# EAGLE schematic EPGcontrol-TOLDO (EAGLE 7.7.0)
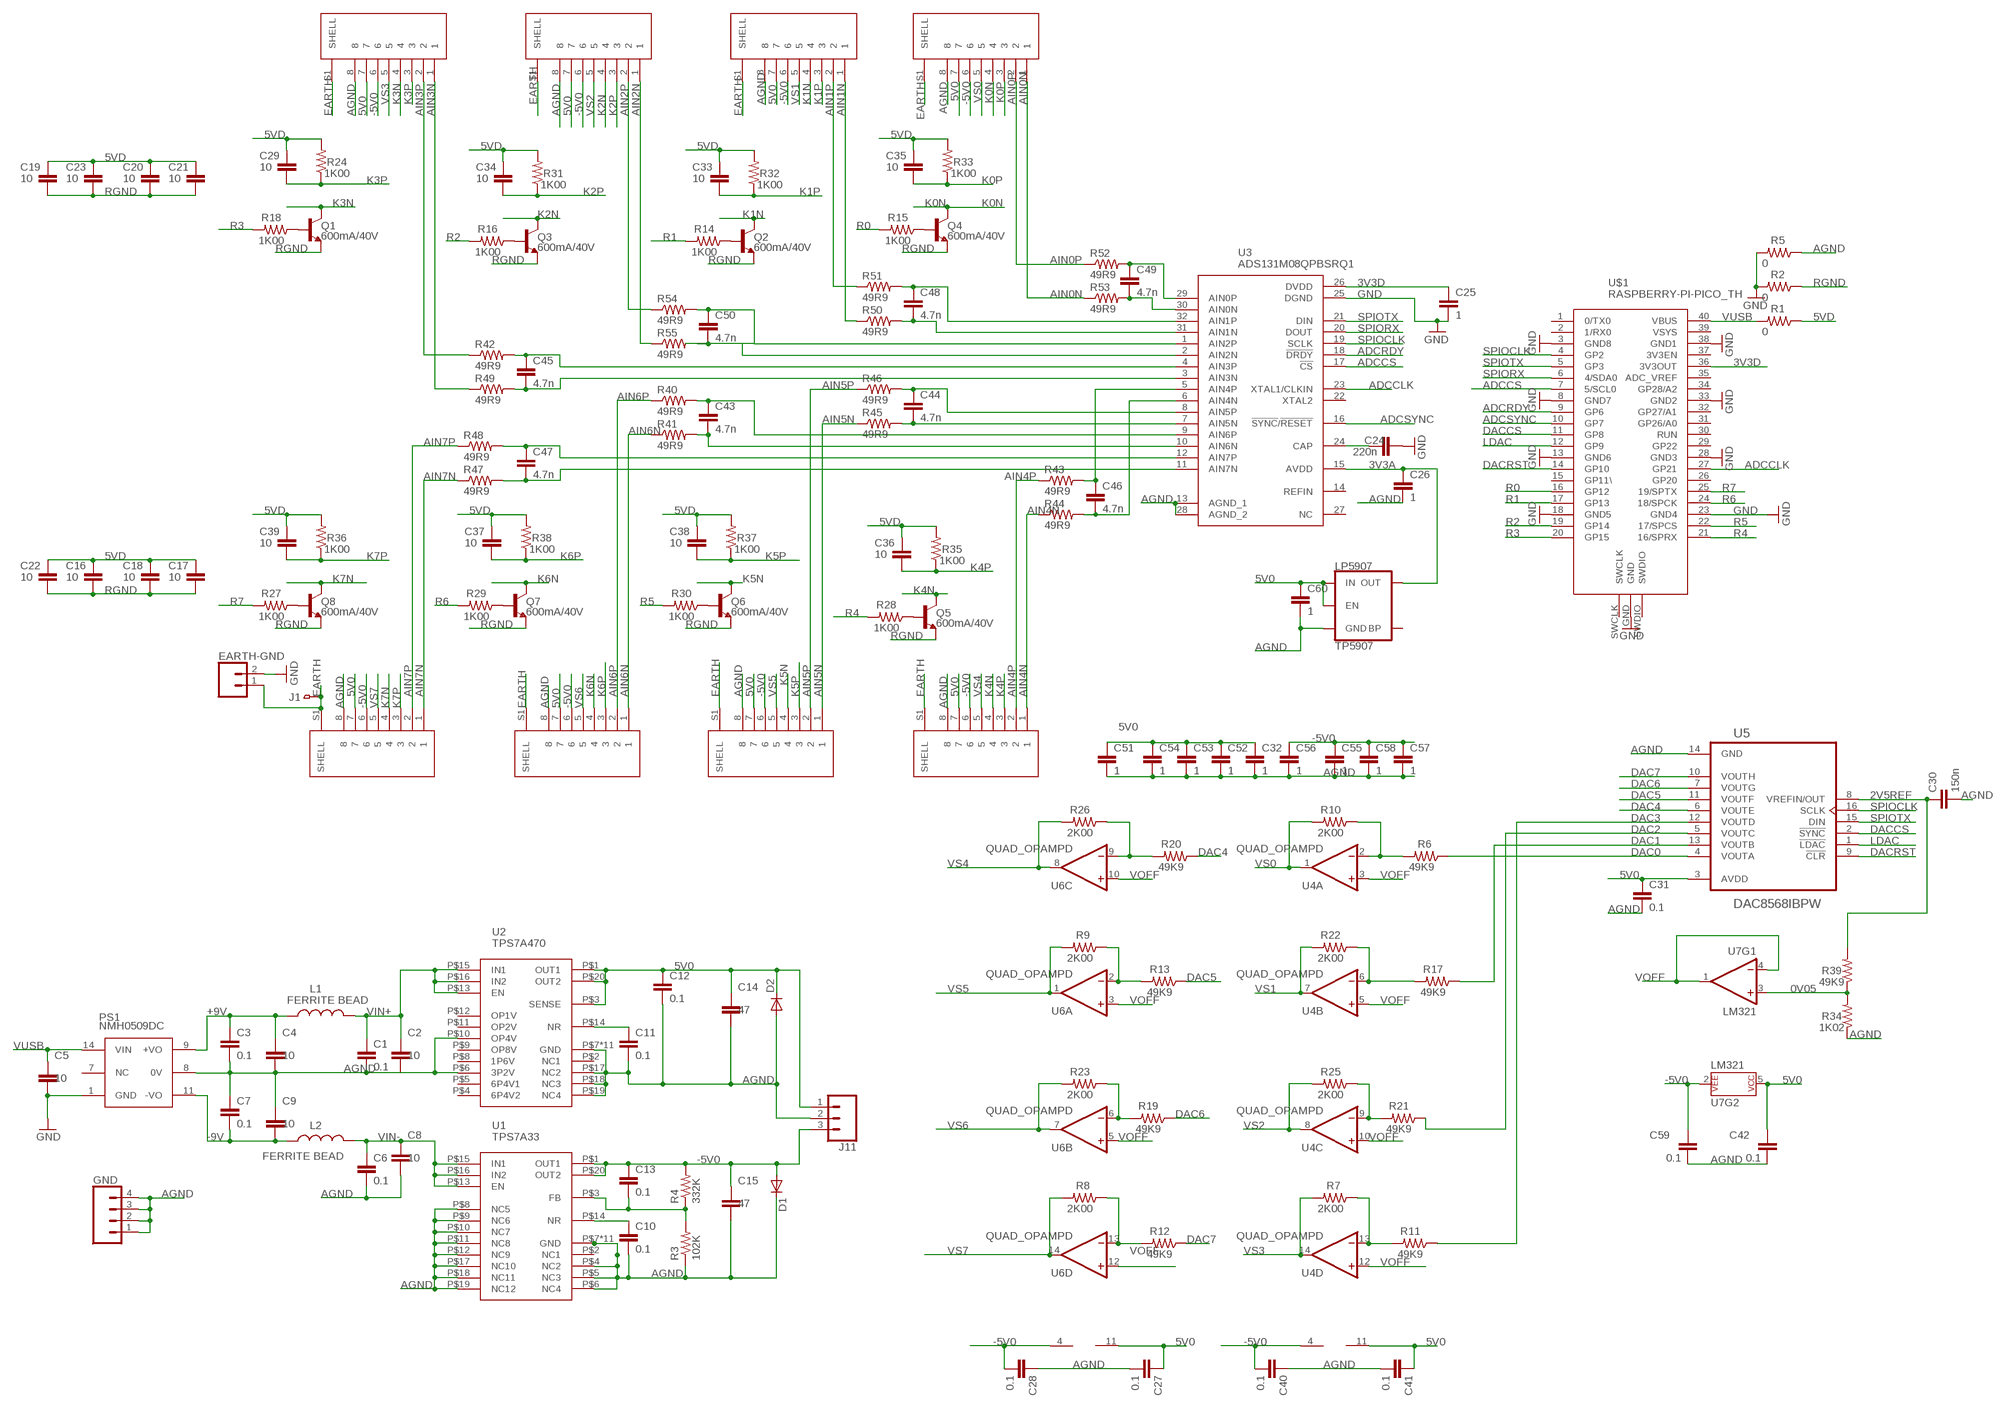
[diagram p0: schematic, sheet 1]

## Parts
C1  0.1  CAPS0603S  [0603S]
C2  10  CAPS1210S  [1210S]
C3  0.1  CAPS0603S  [0603S]
C4  10  CAPS1210S  [1210S]
C5  10  CAPS1210S  [1210S]
C6  0.1  CAPS0603S  [0603S]
C7  0.1  CAPS0603S  [0603S]
C8  10  CAPS1210S  [1210S]
C9  10  CAPS1210S  [1210S]
C10  0.1  CAPS0603S  [0603S]
C11  0.1  CAPS0603S  [0603S]
C12  0.1  CAPS0603S  [0603S]
C13  0.1  CAPS0603S  [0603S]
C14  47  CAPS1210S  [1210S]
C15  47  CAPS1210S  [1210S]
C16  10  CAPS1206S  [1206S]
C17  10  CAPS1206S  [1206S]
C18  10  CAPS1206S  [1206S]
C19  10  CAPS1206S  [1206S]
C20  10  CAPS1206S  [1206S]
C21  10  CAPS1206S  [1206S]
C22  10  CAPS1206S  [1206S]
C23  10  CAPS1206S  [1206S]
C24  220n  CAPS0603S  [0603S]
C25  1  CAPS0805S  [0805S]
C26  1  CAPS0805S  [0805S]
C27  0.1  CAPS0603S  [0603S]
C28  0.1  CAPS0603S  [0603S]
C29  10  CAPS1206S  [1206S]
C30  150n  CAPS0603S  [0603S]
C31  0.1  CAPS0603S  [0603S]
C32  1  CAPS0805S  [0805S]
C33  10  CAPS1206S  [1206S]
C34  10  CAPS1206S  [1206S]
C35  10  CAPS1206S  [1206S]
C36  10  CAPS1206S  [1206S]
C37  10  CAPS1206S  [1206S]
C38  10  CAPS1206S  [1206S]
C39  10  CAPS1206S  [1206S]
C40  0.1  CAPS0603S  [0603S]
C41  0.1  CAPS0603S  [0603S]
C42  0.1  CAPS0603S  [0603S]
C43  4.7n  CAPS0805S  [0805S]
C44  4.7n  CAPS0805S  [0805S]
C45  4.7n  CAPS0805S  [0805S]
C46  4.7n  CAPS0805S  [0805S]
C47  4.7n  CAPS0805S  [0805S]
C48  4.7n  CAPS0805S  [0805S]
C49  4.7n  CAPS0805S  [0805S]
C50  4.7n  CAPS0805S  [0805S]
C51  1  CAPS0805S  [0805S]
C52  1  CAPS0805S  [0805S]
C53  1  CAPS0805S  [0805S]
C54  1  CAPS0805S  [0805S]
C55  1  CAPS0805S  [0805S]
C56  1  CAPS0805S  [0805S]
C57  1  CAPS0805S  [0805S]
C58  1  CAPS0805S  [0805S]
C59  0.1  CAPS0603S  [0603S]
C60  1  CAPS0805S  [0805S]
D1  DIODESMA  [SMA-DIODE]
D2  DIODESMA  [SMA-DIODE]
EARTH-GND  CONN_02LOCK  [1X02_LOCK]
GND  CONN_04LOCK  [1X04_LOCK]
J1  PADPAD_040  [PAD_040]
J2  54-00248  [TENSILITY_54-00248]
J3  54-00248  [TENSILITY_54-00248]
J4  54-00248  [TENSILITY_54-00248]
J5  54-00248  [TENSILITY_54-00248]
J6  54-00248  [TENSILITY_54-00248]
J7  54-00248  [TENSILITY_54-00248]
J8  54-00248  [TENSILITY_54-00248]
J9  54-00248  [TENSILITY_54-00248]
J11  CONN_03LOCK  [1X03_LOCK]
L1  FERRITE BEAD  INDUCTOR_SM0805S  [0805S]
L2  FERRITE BEAD  INDUCTOR_SM0805S  [0805S]
LP5907  TP5907  V_REG_MIC52193.3V  [SOT23-5]
PS1  NMH0509DC  DC-DC-PDS1-DUALPDM2  [PDM2]
Q1  600mA/40V  TRANS_NPN-MMBT2222AL  [SOT23-3]
Q2  600mA/40V  TRANS_NPN-MMBT2222AL  [SOT23-3]
Q3  600mA/40V  TRANS_NPN-MMBT2222AL  [SOT23-3]
Q4  600mA/40V  TRANS_NPN-MMBT2222AL  [SOT23-3]
Q5  600mA/40V  TRANS_NPN-MMBT2222AL  [SOT23-3]
Q6  600mA/40V  TRANS_NPN-MMBT2222AL  [SOT23-3]
Q7  600mA/40V  TRANS_NPN-MMBT2222AL  [SOT23-3]
Q8  600mA/40V  TRANS_NPN-MMBT2222AL  [SOT23-3]
R1  0  RESISTOR_SM0805S  [0805S]
R2  0  RESISTOR_SM0805S  [0805S]
R3  102K  R-US_R0805  [R0805]
R4  332K  R-US_R0805  [R0805]
R5  0  RESISTOR_SM0805S  [0805S]
R6  49K9  RESISTOR_SM0805S  [0805S]
R7  2K00  RESISTOR_SM0805S  [0805S]
R8  2K00  RESISTOR_SM0805S  [0805S]
R9  2K00  RESISTOR_SM0805S  [0805S]
R10  2K00  RESISTOR_SM0805S  [0805S]
R11  49K9  RESISTOR_SM0805S  [0805S]
R12  49K9  RESISTOR_SM0805S  [0805S]
R13  49K9  RESISTOR_SM0805S  [0805S]
R14  1K00  RESISTOR_SM0805S  [0805S]
R15  1K00  RESISTOR_SM0805S  [0805S]
R16  1K00  RESISTOR_SM0805S  [0805S]
R17  49K9  RESISTOR_SM0805S  [0805S]
R18  1K00  RESISTOR_SM0805S  [0805S]
R19  49K9  RESISTOR_SM0805S  [0805S]
R20  49K9  RESISTOR_SM0805S  [0805S]
R21  49K9  RESISTOR_SM0805S  [0805S]
R22  2K00  RESISTOR_SM0805S  [0805S]
R23  2K00  RESISTOR_SM0805S  [0805S]
R24  1K00  RESISTOR_SM0805S  [0805S]
R25  2K00  RESISTOR_SM0805S  [0805S]
R26  2K00  RESISTOR_SM0805S  [0805S]
R27  1K00  RESISTOR_SM0805S  [0805S]
R28  1K00  RESISTOR_SM0805S  [0805S]
R29  1K00  RESISTOR_SM0805S  [0805S]
R30  1K00  RESISTOR_SM0805S  [0805S]
R31  1K00  RESISTOR_SM0805S  [0805S]
R32  1K00  RESISTOR_SM0805S  [0805S]
R33  1K00  RESISTOR_SM0805S  [0805S]
R34  1K02  RESISTOR_SM0805S  [0805S]
R35  1K00  RESISTOR_SM0805S  [0805S]
R36  1K00  RESISTOR_SM0805S  [0805S]
R37  1K00  RESISTOR_SM0805S  [0805S]
R38  1K00  RESISTOR_SM0805S  [0805S]
R39  49K9  RESISTOR_SM0805S  [0805S]
R40  49R9  RESISTOR_SM0805S  [0805S]
R41  49R9  RESISTOR_SM0805S  [0805S]
R42  49R9  RESISTOR_SM0805S  [0805S]
R43  49R9  RESISTOR_SM0805S  [0805S]
R44  49R9  RESISTOR_SM0805S  [0805S]
R45  49R9  RESISTOR_SM0805S  [0805S]
R46  49R9  RESISTOR_SM0805S  [0805S]
R47  49R9  RESISTOR_SM0805S  [0805S]
R48  49R9  RESISTOR_SM0805S  [0805S]
R49  49R9  RESISTOR_SM0805S  [0805S]
R50  49R9  RESISTOR_SM0805S  [0805S]
R51  49R9  RESISTOR_SM0805S  [0805S]
R52  49R9  RESISTOR_SM0805S  [0805S]
R53  49R9  RESISTOR_SM0805S  [0805S]
R54  49R9  RESISTOR_SM0805S  [0805S]
R55  49R9  RESISTOR_SM0805S  [0805S]
U1  TPS7A33  [VQFN-20-5X5]
U2  TPS7A470  TPS7A470X  [VQFN-20-5X5]
U3  ADS131M08QPBSRQ1  [QFP50P700X700X120-32N]
U4  QUAD_OPAMPD  [SO14]
U5  DAC8568IBPW  [SOP65P640X120-16N]
U6  QUAD_OPAMPD  [SO14]
U7  LM321  OPA344  [SOT23-5]
U$1  RASPBERRY-PI-PICO_TH  [FT_RASPBERRY-PI-PICO_TH]

## Nets
0V05: R34.2 R39.1 U7.3(+IN)
2V5REF: C30.1 R39.2 U5.8(VREFIN/OUT)
3V3A: C26.1 LP5907.5(OUT) U3.15(AVDD)
3V3D: C25.1 U3.26(DVDD) U$1.36(3V3OUT)
5V0: C12.1 C14.1 C27.1 C31.1 C32.1 C41.1 C42.1 C51.1 C52.1 C53.1 C54.1 C60.1 D2.C J2.7 J3.7 J4.7 J5.7 J6.7 J7.7 J8.7 J9.7 J11.1 LP5907.1(IN) LP5907.3(EN) U2.P$1(OUT1) U2.P$3(SENSE) U2.P$20(OUT2) U4.11(P:V-) U5.3(AVDD) U6.11(P:V-) U7.5(P$V+)
5VD: C16.1 C17.1 C18.1 C19.1 C20.1 C21.1 C22.1 C23.1 C29.1 C33.1 C34.1 C35.1 C36.1 C37.1 C38.1 C39.1 R1.1 R24.2 R31.2 R32.2 R33.2 R35.2 R36.2 R37.2 R38.2
+9V: C3.1 C4.1 L1.1 PS1.9(+VO)
-5V0: C13.1 C15.1 C28.2 C40.2 C55.1 C56.1 C57.1 C58.1 C59.1 D1.A J2.6 J3.6 J4.6 J5.6 J6.6 J7.6 J8.6 J9.6 J11.3 R4.2 U1.P$1(OUT1) U1.P$20(OUT2) U4.4(P:V+) U6.4(P:V+) U7.2(P$V-)
-9V: C7.2 C9.2 L2.1 PS1.11(-VO)
A0N: C49.2 R53.2 U3.30(AIN0N)
A0P: C49.1 R52.2 U3.29(AIN0P)
A1N: C48.2 R50.2 U3.31(AIN1N)
A1P: C48.1 R51.2 U3.32(AIN1P)
A2N: C50.2 R55.2 U3.2(AIN2N)
A2P: C50.1 R54.2 U3.1(AIN2P)
A3N: C45.2 R49.2 U3.3(AIN3N)
A3P: C45.1 R42.2 U3.4(AIN3P)
A4N: C46.2 R44.2 U3.6(AIN4N)
A4P: C46.1 R43.2 U3.5(AIN4P)
A5N: C44.2 R45.2 U3.7(AIN5N)
A5P: C44.1 R46.2 U3.8(AIN5P)
A6N: C43.2 R41.2 U3.10(AIN6N)
A6P: C43.1 R40.2 U3.9(AIN6P)
A7N: C47.2 R47.2 U3.11(AIN7N)
A7P: C47.1 R48.2 U3.12(AIN7P)
ADCCLK: U3.23(XTAL1/CLKIN) U$1.27(GP21)
ADCCS: U3.17(!CS) U$1.7(5/SCL0)
ADCRDY: U3.18(!DRDY) U$1.9(GP6)
ADCSYNC: U3.16(!SYNC!/!RESET) U$1.10(GP7)
AGND: C1.2 C2.2 C3.2 C4.2 C6.2 C7.1 C8.2 C9.1 C10.2 C11.2 C12.2 C14.2 C15.2 C26.2 C27.2 C28.1 C30.2 C31.2 C32.2 C40.1 C41.2 C42.2 C51.2 C52.2 C53.2 C54.2 C55.2 C56.2 C57.2 C58.2 C59.2 C60.2 D1.C D2.A GND.1 GND.2 GND.3 GND.4 J2.8 J3.8 J4.8 J5.8 J6.8 J7.8 J8.8 J9.8 J11.2 LP5907.2(GND) PS1.8(0V) R3.1 R5.1 R34.1 U1.P$4(NC2) U1.P$5(NC3) U1.P$6(NC4) U1.P$7(GND) U1.P$8(NC5) U1.P$9(NC6) U1.P$10(NC7) U1.P$11(NC8) U1.P$12(NC9) U1.P$17(NC10) U1.P$18(NC11) U1.P$19(NC12) U1.P$21(GND) U1.PAD1(GND) U1.PAD2(GND) U1.PAD3(GND) U1.PAD4(GND) U1.PAD5(GND) U1.PAD6(GND) U1.PAD7(GND) U1.PAD8(GND) U1.PAD9(GND) U2.P$6(3P2V) U2.P$7(GND) U2.P$10(OP4V) U2.P$17(NC2) U2.P$18(NC3) U2.P$19(NC4) U2.P$21(GND) U2.PAD1(GND) U2.PAD2(GND) U2.PAD3(GND) U2.PAD4(GND) U2.PAD5(GND) U2.PAD6(GND) U2.PAD7(GND) U2.PAD8(GND) U2.PAD9(GND) U3.13(AGND_1) U3.28(AGND_2) U5.14(GND)
AIN0N: J2.1 R53.1
AIN0P: J2.2 R52.1
AIN1N: J3.1 R50.1
AIN1P: J3.2 R51.1
AIN2N: J4.1 R55.1
AIN2P: J4.2 R54.1
AIN3N: J5.1 R49.1
AIN3P: J5.2 R42.1
AIN4N: J6.1 R44.1
AIN4P: J6.2 R43.1
AIN5N: J7.1 R45.1
AIN5P: J7.2 R46.1
AIN6N: J8.1 R41.1
AIN6P: J8.2 R40.1
AIN7N: J9.1 R47.1
AIN7P: J9.2 R48.1
DAC0: R6.1 U5.4(VOUTA)
DAC1: R17.1 U5.13(VOUTB)
DAC2: R21.1 U5.5(VOUTC)
DAC3: R11.1 U5.12(VOUTD)
DAC4: R20.1 U5.6(VOUTE)
DAC5: R13.1 U5.11(VOUTF)
DAC6: R19.1 U5.7(VOUTG)
DAC7: R12.1 U5.10(VOUTH)
DACCS: U5.2(!SYNC) U$1.11(GP8)
DACRST: U5.9(!CLR) U$1.14(GP10)
EARTH: EARTH-GND.1 J1.P$1 J2.S1(SHELL) J3.S1(SHELL) J4.S1(SHELL) J5.S1(SHELL) J6.S1(SHELL) J7.S1(SHELL) J8.S1(SHELL) J9.S1(SHELL)
GND: C5.2 C24.2 C25.2 EARTH-GND.2 PS1.1(GND) R2.2 R5.2 U3.25(DGND) U$1.3(GND8) U$1.8(GND7) U$1.13(GND6) U$1.18(GND5) U$1.23(GND4) U$1.28(GND3) U$1.33(GND2) U$1.38(GND1) U$1.GND
K0N: J2.4 Q4.3(C)
K0P: C35.2 J2.3 R33.1
K1N: J3.4 Q2.3(C)
K1P: C33.2 J3.3 R32.1
K2N: J4.4 Q3.3(C)
K2P: C34.2 J4.3 R31.1
K3N: J5.4 Q1.3(C)
K3P: C29.2 J5.3 R24.1
K4N: J6.4 Q5.3(C)
K4P: C36.2 J6.3 R35.1
K5N: J7.4 Q6.3(C)
K5P: C38.2 J7.3 R37.1
K6N: J8.4 Q7.3(C)
K6P: C37.2 J8.3 R38.1
K7N: J9.4 Q8.3(C)
K7P: C39.2 J9.3 R36.1
LDAC: U5.1(!LDAC) U$1.12(GP9)
N$1: C13.2 R3.2 R4.1 U1.P$3(FB)
N$2: C24.1 U3.24(CAP)
N$3: Q7.1(B) R29.1
N$4: Q8.1(B) R27.1
N$5: Q1.1(B) R18.1
N$6: Q6.1(B) R30.1
N$7: Q5.1(B) R28.1
N$8: Q4.1(B) R15.1
N$9: Q2.1(B) R14.1
N$11: Q3.1(B) R16.1
N$12: R6.2 R10.1 U4.2(A:-IN)
N$13: R17.2 R22.1 U4.6(B:-IN)
N$15: R20.2 R26.1 U6.9(C:-IN)
N$18: C10.1 U1.P$14(NR)
N$19: R9.1 R13.2 U6.2(A:-IN)
N$20: R21.2 R25.1 U4.9(C:-IN)
N$22: R19.2 R23.1 U6.6(B:-IN)
N$23: C11.1 U2.P$14(NR)
N$24: R8.1 R12.2 U6.13(D:-IN)
N$25: R7.1 R11.2 U4.13(D:-IN)
R0: R15.2 U$1.16(GP12)
R1: R14.2 U$1.17(GP13)
R2: R16.2 U$1.19(GP14)
R3: R18.2 U$1.20(GP15)
R4: R28.2 U$1.21(16/SPRX)
R5: R30.2 U$1.22(17/SPCS)
R6: R29.2 U$1.24(18/SPCK)
R7: R27.2 U$1.25(19/SPTX)
RGND: C16.2 C17.2 C18.2 C19.2 C20.2 C21.2 C22.2 C23.2 Q1.2(E) Q2.2(E) Q3.2(E) Q4.2(E) Q5.2(E) Q6.2(E) Q7.2(E) Q8.2(E) R2.1
SPIOCLK: U3.19(SCLK) U5.16(SCLK) U$1.4(GP2)
SPIORX: U3.20(DOUT) U$1.6(4/SDA0)
SPIOTX: U3.21(DIN) U5.15(DIN) U$1.5(GP3)
VIN+: C1.1 C2.1 L1.2 U2.P$13(EN) U2.P$15(IN1) U2.P$16(IN2)
VIN-: C6.1 C8.1 L2.2 U1.P$13(EN) U1.P$15(IN1) U1.P$16(IN2)
VOFF: U4.3(A:+IN) U4.5(B:+IN) U4.10(C:+IN) U4.12(D:+IN) U6.3(A:+IN) U6.5(B:+IN) U6.10(C:+IN) U6.12(D:+IN) U7.1(OUT) U7.4(-IN)
VS0: J2.5 R10.2 U4.1(A:OUT)
VS1: J3.5 R22.2 U4.7(B:OUT)
VS2: J4.5 R25.2 U4.8(C:OUT)
VS3: J5.5 R7.2 U4.14(D:OUT)
VS4: J6.5 R26.2 U6.8(C:OUT)
VS5: J7.5 R9.2 U6.1(A:OUT)
VS6: J8.5 R23.2 U6.7(B:OUT)
VS7: J9.5 R8.2 U6.14(D:OUT)
VUSB: C5.1 PS1.14(VIN) R1.2 U$1.40(VBUS)
Unconnected: LP5907.4(BP) PS1.7(NC) U1.P$2(NC1) U2.P$2(NC1) U2.P$4(6P4V2) U2.P$5(6P4V1) U2.P$8(1P6V) U2.P$9(OP8V) U2.P$11(OP2V) U2.P$12(OP1V) U3.14(REFIN) U3.22(XTAL2) U3.27(NC) U$1.1(0/TX0) U$1.2(1/RX0) U$1.15(GP11\) U$1.26(GP20) U$1.29(GP22) U$1.30(RUN) U$1.31(GP26/A0) U$1.32(GP27/A1) U$1.34(GP28/A2) U$1.35(ADC_VREF) U$1.37(3V3EN) U$1.39(VSYS) U$1.SWCLK U$1.SWDIO

## Library data of the parts
C1-C60 = STEVES_BU:CAPS
D1 D2 = SparkFun:DIODE: Diode These are standard reverse protection diodes and small signal diodes. SMA package can handle up to about 1A. SOD-323 can handle about 200mA. What the SOD-323 package when ordering, there are some mfgs out there that are 5-pin packages.
EARTH-GND = SparkFun-Connectors:CONN_02: Multi connection point. Often used as Generic Header-pin footprint for 0.1 inch spaced/style header connections On any of the 0.1 inch spaced packages, you can populate with these: Break Away Headers - Straight <https://www.sparkfun.com/products/116> (PRT-00116) Break Away Male Headers - Right Angle <https://www.sparkfun.com/products/553> (PRT-00553) Female Headers <https://www.sparkfun.com/products/115> (PRT-00115) Break Away Headers - Machine Pin <https://www.sparkfun.com/products/117> (PRT-00117) Break Away Female Headers - Swiss Machine Pin <https://www.sparkfun.com/products/743> (PRT-00743) For SCREWTERMINALS and SPRING TERMINALS visit here: Screw Terimnals on SparkFun.com <https://www.sparkfun.com/search/results?term=Screw+Terminals> (5mm/3.5mm/2.54mm spacing) This device is also useful as a general connection point to wire up your design to another part of your project. Our various solder wires solder well into these plated through hole pads. Hook-Up Wire - Assortment (Stranded, 22 AWG) <https://www.sparkfun.com/products/11375> (PRT-11375) Hook-Up Wire - Assortment (Solid Core, 22 AWG) <https://www.sparkfun.com/products/11367> (PRT-11367) View the entire wire category on our website here <https://www.sparkfun.com/categories/141> Special notes: Molex polarized connector foot print use with: PRT-08233 with associated crimp pins and housings. 2.54_SCREWTERM for use with PRT-10571. 3.5mm Screw Terminal footprints for PRT-08084 5mm Screw Terminal footprints for use with PRT-08432
GND = SparkFun-Connectors:CONN_04: Multi connection point. Often used as Generic Header-pin footprint for 0.1 inch spaced/style header connections On any of the 0.1 inch spaced packages, you can populate with these: Break Away Headers - Straight <https://www.sparkfun.com/products/116> (PRT-00116) Break Away Male Headers - Right Angle <https://www.sparkfun.com/products/553> (PRT-00553) Female Headers <https://www.sparkfun.com/products/115> (PRT-00115) Break Away Headers - Machine Pin <https://www.sparkfun.com/products/117> (PRT-00117) Break Away Female Headers - Swiss Machine Pin <https://www.sparkfun.com/products/743> (PRT-00743) For SCREWTERMINALS and SPRING TERMINALS visit here: Screw Terimnals on SparkFun.com <https://www.sparkfun.com/search/results?term=Screw+Terminals> (5mm/3.5mm/2.54mm spacing) This device is also useful as a general connection point to wire up your design to another part of your project. Our various solder wires solder well into these plated through hole pads. Hook-Up Wire - Assortment (Stranded, 22 AWG) <https://www.sparkfun.com/products/11375> (PRT-11375) Hook-Up Wire - Assortment (Solid Core, 22 AWG) <https://www.sparkfun.com/products/11367> (PRT-11367) View the entire wire category on our website here <https://www.sparkfun.com/categories/141> Special notes: Molex polarized connector foot print use with SKU : PRT-08231 with associated crimp pins and housings. 1MM SMD Version SKU: PRT-10208; PROD_ID: CONN-09696
J1 = STEVES_BU:PAD
J2-J9 = 54-00248:54-00248
J11 = SparkFun-Connectors:CONN_03: Multi connection point. Often used as Generic Header-pin footprint for 0.1 inch spaced/style header connections On any of the 0.1 inch spaced packages, you can populate with these: Break Away Headers - Straight <https://www.sparkfun.com/products/116> (PRT-00116) Break Away Male Headers - Right Angle <https://www.sparkfun.com/products/553> (PRT-00553) Female Headers <https://www.sparkfun.com/products/115> (PRT-00115) Break Away Headers - Machine Pin <https://www.sparkfun.com/products/117> (PRT-00117) Break Away Female Headers - Swiss Machine Pin <https://www.sparkfun.com/products/743> (PRT-00743) Stackable Header - 3 Pin (Female, 0.1") <https://www.sparkfun.com/products/13875> (PRT-13875) For SCREWTERMINALS and SPRING TERMINALS visit here: Screw Terimnals on SparkFun.com <https://www.sparkfun.com/search/results?term=Screw+Terminals> (5mm/3.5mm/2.54mm spacing) This device is also useful as a general connection point to wire up your design to another part of your project. Our various solder wires solder well into these plated through hole pads. Hook-Up Wire - Assortment (Stranded, 22 AWG) <https://www.sparkfun.com/products/11375> (PRT-11375) Hook-Up Wire - Assortment (Solid Core, 22 AWG) <https://www.sparkfun.com/products/11367> (PRT-11367) View the entire wire category on our website here <https://www.sparkfun.com/categories/141> Special notes: Molex polarized connector foot print use with SKU : PRT-08232 with associated crimp pins and housings.
L1 L2 = STEVES_BU:INDUCTOR_SM
LP5907 = SparkFun-IC-Power:V_REG_MIC5219: V_REG MIC5219 Standard 3.3V and 5V 500mA LDO voltage regulator in SOT-23 layout. Micrel part MIC5219. BP (by-pass) pin is used to lower output noise with 470pF cap, may be left open.; PROD_ID: VREG-09872; VALUE: MIC5219 3.3V
PS1 = STEVES_BU:DC-DC-PDS1-DUAL
Q1-Q8 = SparkFun-DiscreteSemi:TRANS_NPN: NPN transistor Current controlled devices typically used to amplify current or used as a switch. BC547 - COM-08928 <http://www.sparkfun.com/products/8928> (TO-92 45V 100mA) (1.Collector 2.Base 3.Emitter) 2N3904 - COM-00521 <http://www.sparkfun.com/products/521> (TO-92 40V 200mA) (1.Emitter 2.Base 3.Collector) P2N2222A - COM-12852 <http://www.sparkfun.com/products/12852> (TO-92 40V 600mA) (1.Collector 2.Base 3.Emitter); PROD_ID: TRANS-08049
R1 R2 R5-R55 = STEVES_BU:RESISTOR_SM
R3 R4 = rcl:R-US_: RESISTOR, American symbol
U1 = STEVES_BU:TPS7A33: TPS7A33 –36-V, 1-A, Ultralow-Noise Negative Voltage Regulator
U2 = STEVES_BU:TPS7A470X
U3 = SamacSys_Parts:ADS131M08QPBSRQ1: Analog to Digital Converters - ADC Automotive, eight-channel, 24-bit, 32-kSPS, simultaneous-sampling, delta-sigma ADC Source: Datasheet <https://www.ti.com/lit/ds/symlink/ads131m08-q1.pdf?HQS=dis-mous-null-mousermode-dsf-pf-null-wwe&ts=1673864581738&ref_url=https%3A%2F%2Fwww.ti.com%2Fgeneral%2Fdocs%2Fsuppproductinfo.tsp%3FdistId%3D26%26gotoUrl%3Dhttps%3A%2F%2Fwww.>; ARROW_PART_NUMBER: ADS131M08QPBSRQ1; ARROW_PRICE-STOCK: https://www.arrow.com/en/products/ads131m08qpbsrq1/texas-instruments.html?utm_currency=USD&region=nac; DESCRIPTION: Analog to Digital Converters - ADC Automotive, eight-channel, 24-bit, 32-kSPS, simultaneous-sampling, delta-sigma ADC; HEIGHT: 1.2mm; MANUFACTURER_NAME: Texas Instruments; MANUFACTURER_PART_NUMBER: ADS131M08QPBSRQ1; MOUSER_PART_NUMBER: 595-ADS131M08QPBSRQ1; MOUSER_PRICE-STOCK: https://www.mouser.co.uk/ProductDetail/Texas-Instruments/ADS131M08QPBSRQ1?qs=By6Nw2ByBD1kYCTLuI53zA%3D%3D
U4 U6 = adafruit:QUAD_OPAMP: OP AMP Standard quad package
U5 = DAC8568IBPW:DAC8568IBPW
U7 = SparkFun-IC-Amplifiers:OPA344: Single gate rail-to-rail output op-amp. Inputs extend 300mV past rails. Datasheet <http://www.ti.com/product/OPA344> SparkFun Products SparkFun Low Current Sensor <https://www.sparkfun.com/products/8883> (SEN-08883) SparkFun Electret Microphone Breakout <https://www.sparkfun.com/products/12758> (BOB-12758); PROD_ID: IC-08251; VALUE: OPA344
U$1 = pipico:RASPBERRY-PI-PICO_TH: Raspberry Pi Pico microcontroller board for through-hole mounting.